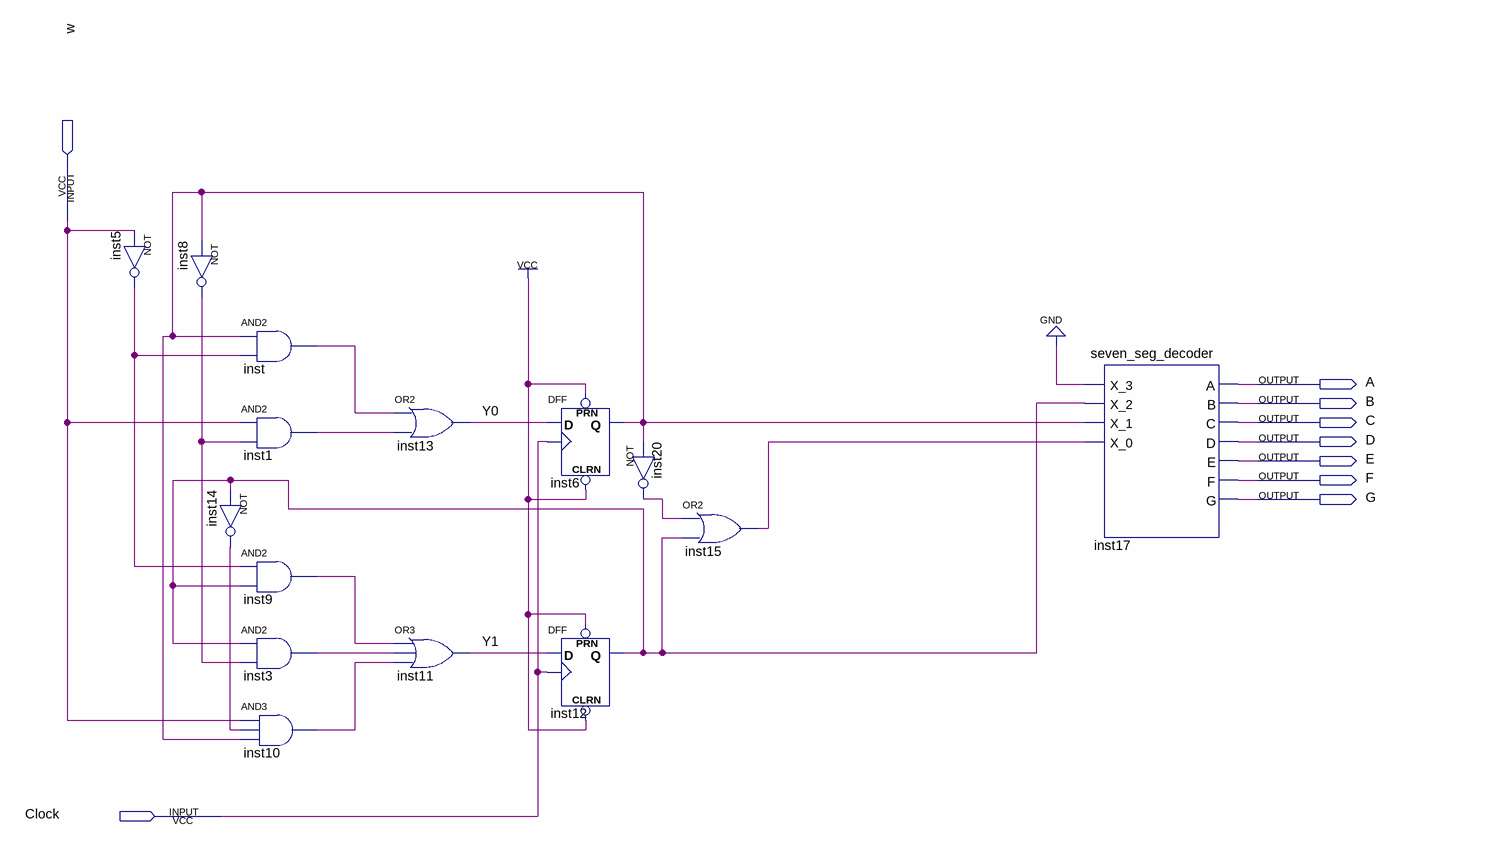
[diagram p0: schematic sheet]
// Quartus schematic Counter_0l.bdf as structural Verilog: 15 symbols, 9 pins
module Counter_0l (
  input  w,
  input  Clock,
  output A,
  output B,
  output C,
  output D,
  output E,
  output F,
  output G
);

  wire inst1_out, inst3_out, inst5_out, inst6_q, inst8_out, inst9_out, inst10_out, inst12_q, inst14_out,
       inst15_out, inst20_out, inst_out, Y0, Y1;

  not inst5 (inst5_out, w);
  not inst8 (inst8_out, inst6_q);
  not inst14 (inst14_out, inst12_q);
  and inst (inst_out, inst6_q, inst5_out);
  and inst1 (inst1_out, w, inst8_out);
  and inst9 (inst9_out, inst5_out, inst12_q);
  and inst3 (inst3_out, inst12_q, inst8_out);
  and inst10 (inst10_out, w, inst14_out, inst6_q);
  or inst13 (Y0, inst_out, inst1_out);
  or inst11 (Y1, inst9_out, inst3_out, inst10_out);
  DFF inst6 (.CLRN(1'b1), .CLK(Clock), .D(Y0), .PRN(1'b1), .Q(inst6_q));
  DFF inst12 (.CLRN(1'b1), .CLK(Clock), .D(Y1), .PRN(1'b1), .Q(inst12_q));
  not inst20 (inst20_out, inst6_q);
  or inst15 (inst15_out, inst20_out, inst12_q);
  seven_seg_decoder inst17 (
    .X_3(1'b0), .X_2(inst12_q), .X_1(inst6_q), .X_0(inst15_out), .A(A), .B(B), .C(C), .D(D), .E(E), .F(F),
    .G(G));
endmodule
